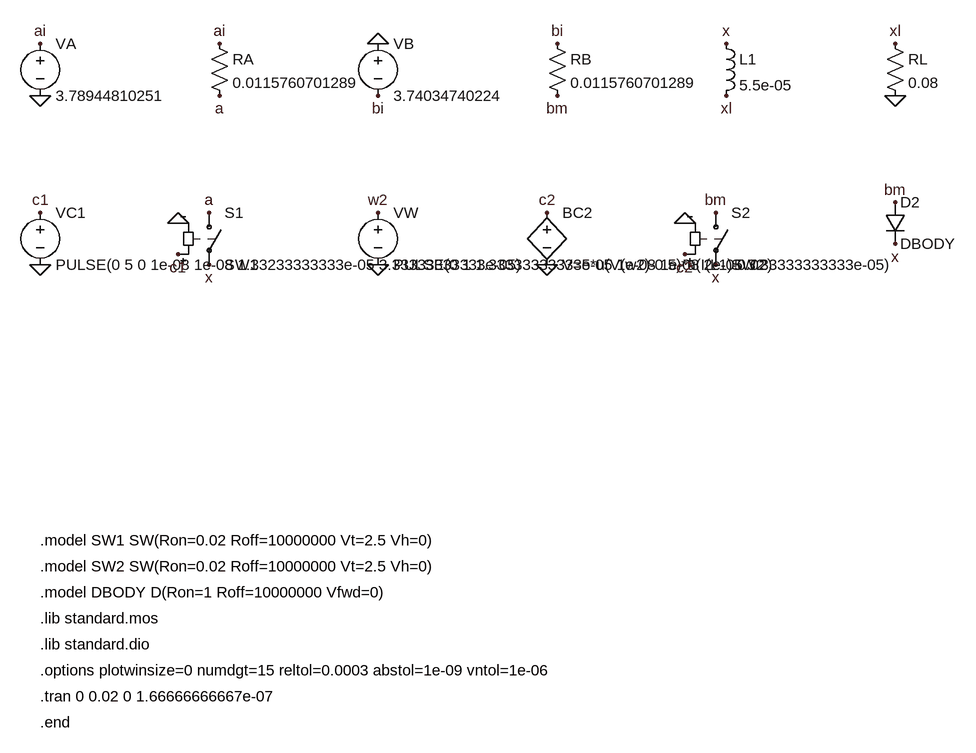
[diagram p0: schematic buck_boost_sync_ideal.asc]
buck_boost_sync_ideal.asc, the LTspice schematic file:
Version 4
SHEET 1 1880 1200
SYMBOL voltage 160 120 R0
SYMATTR InstName VA
SYMATTR Value 3.78944810251
FLAG 160 136 ai
FLAG 160 216 0
SYMBOL res 420 120 R0
SYMATTR InstName RA
SYMATTR Value 0.0115760701289
FLAG 436 136 ai
FLAG 436 216 a
SYMBOL voltage 680 120 R0
SYMATTR InstName VB
SYMATTR Value 3.74034740224
FLAG 680 136 0
FLAG 680 216 bi
SYMBOL res 940 120 R0
SYMATTR InstName RB
SYMATTR Value 0.0115760701289
FLAG 956 136 bi
FLAG 956 216 bm
SYMBOL ind 1200 120 R0
SYMATTR InstName L1
SYMATTR Value 5.5e-05
FLAG 1216 136 x
FLAG 1216 216 xl
SYMBOL res 1460 120 R0
SYMATTR InstName RL
SYMATTR Value 0.08
FLAG 1476 136 xl
FLAG 1476 216 0
SYMBOL voltage 160 380 R0
SYMATTR InstName VC1
SYMATTR Value PULSE(0 5 0 1e-08 1e-08 1.33233333333e-05 3.33333333333e-05)
FLAG 160 396 c1
FLAG 160 476 0
SYMBOL sw 420 380 R0
SYMATTR InstName S1
SYMATTR Value SW1
FLAG 420 396 a
FLAG 420 476 x
FLAG 372 460 c1
FLAG 372 412 0
SYMBOL voltage 680 380 R0
SYMATTR InstName VW
SYMATTR Value PULSE(0 1 1.33333333333e-05 1e-08 1e-08 2e-05 3.33333333333e-05)
FLAG 680 396 w2
FLAG 680 476 0
SYMBOL bv 940 380 R0
SYMATTR InstName BC2
SYMATTR Value V=5*u(V(w2)-0.5)*u(I(L1)-0.02)
FLAG 940 396 c2
FLAG 940 476 0
SYMBOL sw 1200 380 R0
SYMATTR InstName S2
SYMATTR Value SW2
FLAG 1200 396 bm
FLAG 1200 476 x
FLAG 1152 460 c2
FLAG 1152 412 0
SYMBOL diode 1460 380 R0
SYMATTR InstName D2
SYMATTR Value DBODY
FLAG 1476 380 bm
FLAG 1476 444 x
TEXT 160 900 Left 2 !.model SW1 SW(Ron=0.02 Roff=10000000 Vt=2.5 Vh=0)
TEXT 160 940 Left 2 !.model SW2 SW(Ron=0.02 Roff=10000000 Vt=2.5 Vh=0)
TEXT 160 980 Left 2 !.model DBODY D(Ron=1 Roff=10000000 Vfwd=0)
TEXT 160 1020 Left 2 !.lib standard.mos
TEXT 160 1060 Left 2 !.lib standard.dio
TEXT 160 1100 Left 2 !.options plotwinsize=0 numdgt=15 reltol=0.0003 abstol=1e-09 vntol=1e-06
TEXT 160 1140 Left 2 !.tran 0 0.02 0 1.66666666667e-07
TEXT 160 1180 Left 2 !.end

The netlist it stands for:
* buck_boost_sync_ideal.asc
VA ai 0 3.78944810251
RA ai a 0.0115760701289
VB 0 bi 3.74034740224
RB bi bm 0.0115760701289
L1 x xl 5.5e-05
RL xl 0 0.08
VC1 c1 0 PULSE(0 5 0 1e-08 1e-08 1.33233333333e-05 3.33333333333e-05)
S1 a x c1 0 SW1
VW w2 0 PULSE(0 1 1.33333333333e-05 1e-08 1e-08 2e-05 3.33333333333e-05)
BC2 c2 0 V=5*u(V(w2)-0.5)*u(I(L1)-0.02)
S2 bm x c2 0 SW2
D2 bm x DBODY
.model D D
.lib standard.dio
.model SW1 SW(Ron=0.02 Roff=10000000 Vt=2.5 Vh=0)
.model SW2 SW(Ron=0.02 Roff=10000000 Vt=2.5 Vh=0)
.model DBODY D(Ron=1 Roff=10000000 Vfwd=0)
.lib standard.mos
.lib standard.dio
.options plotwinsize=0 numdgt=15 reltol=0.0003 abstol=1e-09 vntol=1e-06
.tran 0 0.02 0 1.66666666667e-07
.end
.backanno
.end